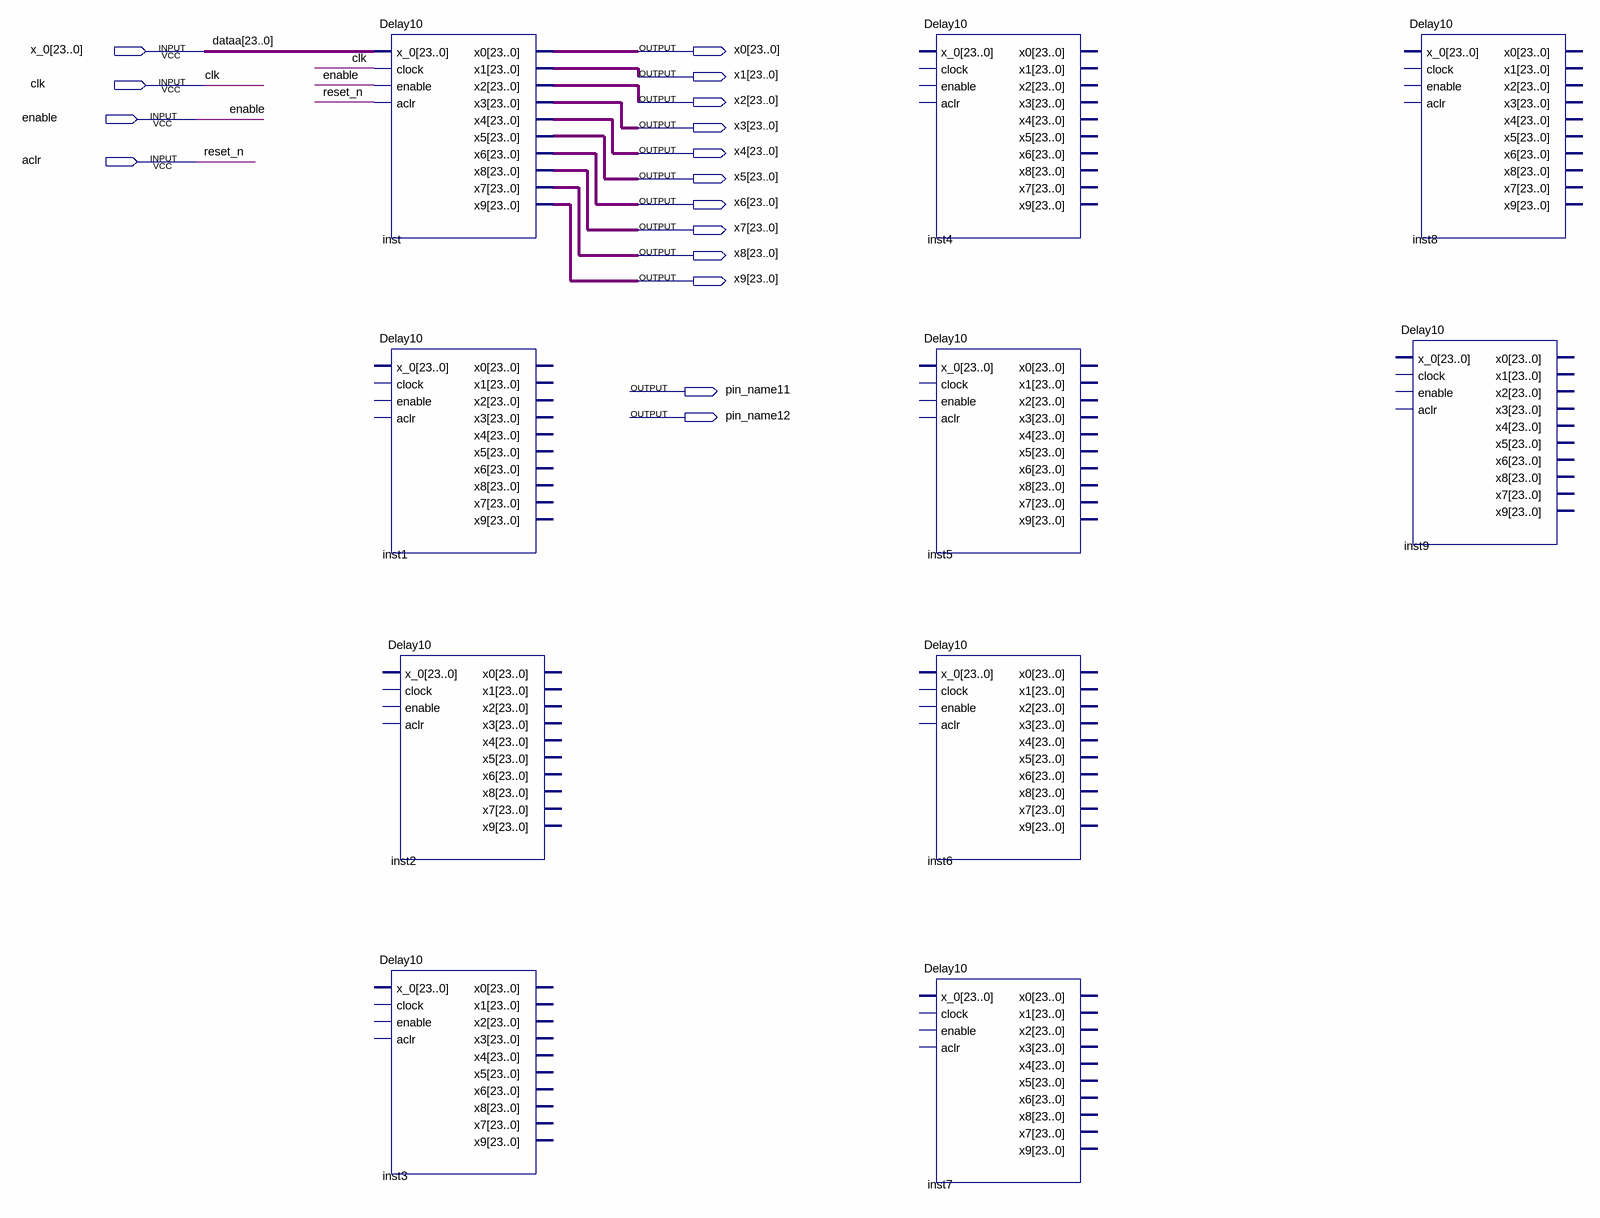
[diagram p0: schematic sheet]
// Quartus schematic Delay100.bdf as structural Verilog: 10 symbols, 16 pins
module Delay100 (
  input  [23:0] x_0,
  input  clk,
  input  enable,
  input  aclr,
  output [23:0] x0,
  output [23:0] x1,
  output [23:0] x2,
  output [23:0] x3,
  output [23:0] x4,
  output [23:0] x5,
  output [23:0] x6,
  output [23:0] x7,
  output [23:0] x8,
  output [23:0] x9,
  output pin_name11,
  output pin_name12
);

  Delay10 inst (
    .x_0(x_0), .clock(clk), .enable(enable), .aclr(aclr), .x0(x0), .x1(x1), .x2(x2), .x3(x3), .x4(x4),
    .x5(x5), .x6(x6), .x8(x7), .x7(x8), .x9(x9));
  Delay10 inst1 ();  // open: x_0, clock, enable, aclr, x0, x1, x2, x3, x4, x5, x6, x8, x7, x9
  Delay10 inst2 ();  // open: x_0, clock, enable, aclr, x0, x1, x2, x3, x4, x5, x6, x8, x7, x9
  Delay10 inst3 ();  // open: x_0, clock, enable, aclr, x0, x1, x2, x3, x4, x5, x6, x8, x7, x9
  Delay10 inst4 ();  // open: x_0, clock, enable, aclr, x0, x1, x2, x3, x4, x5, x6, x8, x7, x9
  Delay10 inst5 ();  // open: x_0, clock, enable, aclr, x0, x1, x2, x3, x4, x5, x6, x8, x7, x9
  Delay10 inst6 ();  // open: x_0, clock, enable, aclr, x0, x1, x2, x3, x4, x5, x6, x8, x7, x9
  Delay10 inst7 ();  // open: x_0, clock, enable, aclr, x0, x1, x2, x3, x4, x5, x6, x8, x7, x9
  Delay10 inst8 ();  // open: x_0, clock, enable, aclr, x0, x1, x2, x3, x4, x5, x6, x8, x7, x9
  Delay10 inst9 ();  // open: x_0, clock, enable, aclr, x0, x1, x2, x3, x4, x5, x6, x8, x7, x9

  // Other names for the same wires on the sheet: dataa[23:0] = x_0; reset_n = aclr
endmodule
